# Altium schematic sheet Keyb_ESP32_simple.SchDoc
size A4; SheetNumber: 1; SheetTotal: 2
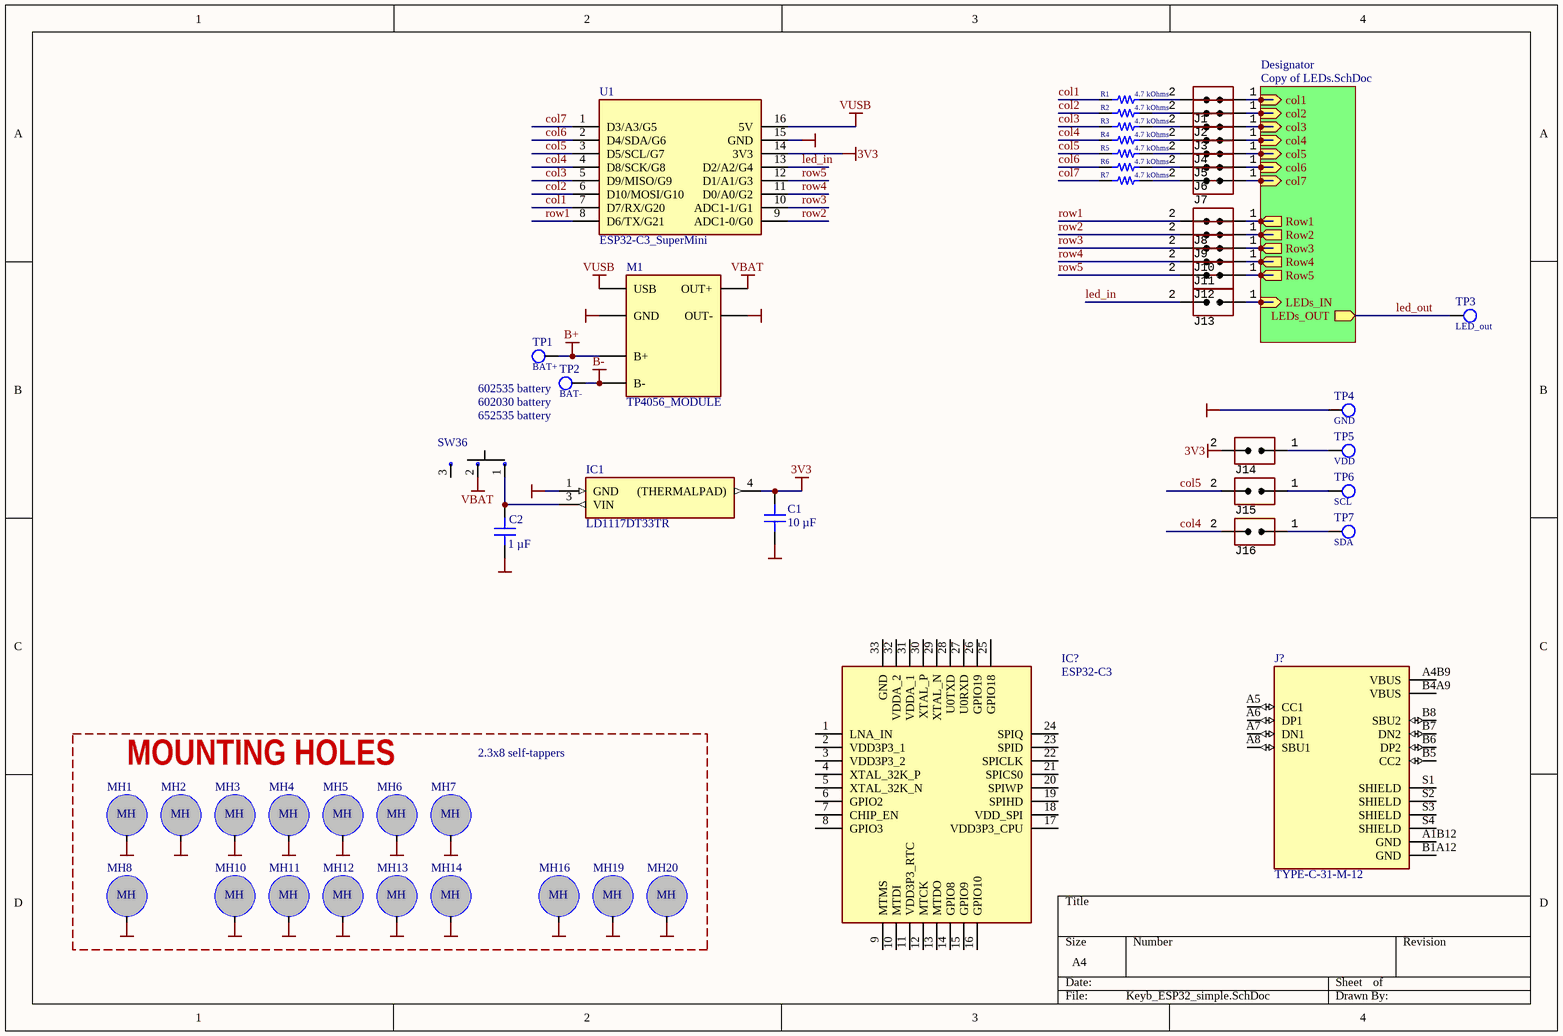
[diagram p0: Keyb_ESP32_simple.SchDoc]

## Parts
C1  10 µF  [CAP 0805_2012]
C2  1 µF  [CAP 0805_2012]
IC1  LD1117DT33TR  [TO228P972X240-3N]
IC?  ESP32-C3  [QFN50P500X500X90-33N-D]
J1  (no value)  [CON: JUMPER x1]
J2  (no value)  [CON: JUMPER x1]
J3  (no value)  [CON: JUMPER x1]
J4  (no value)  [CON: JUMPER x1]
J5  (no value)  [CON: JUMPER x1]
J6  (no value)  [CON: JUMPER x1]
J7  (no value)  [CON: JUMPER x1]
J8  (no value)  [CON: JUMPER x1]
J9  (no value)  [CON: JUMPER x1]
J10  (no value)  [CON: JUMPER x1]
J11  (no value)  [CON: JUMPER x1]
J12  (no value)  [CON: JUMPER x1]
J13  (no value)  [CON: JUMPER x1]
J14  (no value)  [CON: JUMPER x1]
J15  (no value)  [CON: JUMPER x1]
J16  (no value)  [CON: JUMPER x1]
J?  TYPE-C-31-M-12  [HRO_TYPE-C-31-M-12]
M1  TP4056_MODULE  [TP4056_MODULE]
MH1  MountingHole  [Hole_2.5mm]  (value not drawn)
MH2  MountingHole  [Hole_2.5mm]  (value not drawn)
MH3  MountingHole  [Hole_2.5mm]  (value not drawn)
MH4  MountingHole  [Hole_2.5mm]  (value not drawn)
MH5  MountingHole  [Hole_2.5mm]  (value not drawn)
MH6  MountingHole  [Hole_2.5mm]  (value not drawn)
MH7  MountingHole  [Hole_2.5mm]  (value not drawn)
MH8  MountingHole  [Hole_2.5mm]  (value not drawn)
MH10  MountingHole  [Hole_2.5mm]  (value not drawn)
MH11  MountingHole  [Hole_2.5mm]  (value not drawn)
MH12  MountingHole  [Hole_2.5mm]  (value not drawn)
MH13  MountingHole  [Hole_2.5mm]  (value not drawn)
MH14  MountingHole  [Hole_2.5mm]  (value not drawn)
MH16  MountingHole  [Hole_2.5mm]  (value not drawn)
MH19  MountingHole  [Hole_2.5mm]  (value not drawn)
MH20  MountingHole  [Hole_2.5mm]  (value not drawn)
R1  4.7 kOhms  [RES 0603_1608]
R2  4.7 kOhms  [RES 0603_1608]
R3  4.7 kOhms  [RES 0603_1608]
R4  4.7 kOhms  [RES 0603_1608]
R5  4.7 kOhms  [RES 0603_1608]
R6  4.7 kOhms  [RES 0603_1608]
R7  4.7 kOhms  [RES 0603_1608]
SW36  RockerSwitch_3mm  [SLIDE_SW_BIG]  (value not drawn)
TP1  BAT+  [TESTPOINT_PAD]
TP2  BAT-  [TESTPOINT_PAD]
TP3  LED_out  [TESTPOINT_PAD]
TP4  GND  [TESTPOINT_PAD]
TP5  VDD  [TESTPOINT_PAD]
TP6  SCL  [TESTPOINT_PAD]
TP7  SDA  [TESTPOINT_PAD]
U1  ESP32-C3_SuperMini  [ESP32-C3_SUPER_MINI]

## Blocks framed on the sheet
MOUNTING HOLES: MH1-MH8 MH10-MH14 MH16 MH19 MH20

## Sub-sheets
Designator = Copy of LEDs.SchDoc: col1 (in), col4 (in), col2 (in), col7 (in), col5 (in), col3 (in), col6 (in), Row5 (out), Row1 (out), Row2 (out), Row3 (out), Row4 (out), LEDs_IN (in), LEDs_OUT (out)

## Nets
3V3: C1.2 IC1.4((THERMALPAD)) J14.2(IN) U1.14(3V3)
B+: M1.B+ TP1.1
B-: M1.B- TP2.1
GND: C1.1 C2.1 IC1.1(GND) M1.GND M1.OUT- MH1.0 MH2.0 MH3.0 MH4.0 MH5.0 MH6.0 MH7.0 MH8.0 MH10.0 MH11.0 MH12.0 MH13.0 MH14.0 MH16.0 MH19.0 MH20.0 TP4.1 U1.15(GND)
VBAT: M1.OUT+ SW36.2
VUSB: M1.USB U1.16(5V)
col1: R1.2 U1.7(D7/RX/G20)
col2: R2.2 U1.6(D10/MOSI/G10)
col3: R3.2 U1.5(D9/MISO/G9)
col4: J16.2(IN) R4.2 U1.4(D8/SCK/G8)
col5: J15.2(IN) R5.2 U1.3(D5/SCL/G7)
col6: R6.2 U1.2(D4/SDA/G6)
col7: R7.2 U1.1(D3/A3/G5)
led_in: J13.2(IN) U1.13(D2/A2/G4)
led_out: TP3.1 ; sheet Designator/LEDs_OUT
row1: J8.2(IN) U1.8(D6/TX/G21)
row2: J9.2(IN) U1.9(ADC1-0/G0)
row3: J10.2(IN) U1.10(ADC1-1/G1)
row4: J11.2(IN) U1.11(D0/A0/G2)
row5: J12.2(IN) U1.12(D1/A1/G3)
NetC2_2: C2.2 IC1.3(VIN) SW36.1
NetJ1_1: J1.1(IN) ; sheet Designator/col1
NetJ1_2: J1.2(IN) R1.1
NetJ2_1: J2.1(IN) ; sheet Designator/col2
NetJ2_2: J2.2(IN) R2.1
NetJ3_1: J3.1(IN) ; sheet Designator/col3
NetJ3_2: J3.2(IN) R3.1
NetJ4_1: J4.1(IN) ; sheet Designator/col4
NetJ4_2: J4.2(IN) R4.1
NetJ5_1: J5.1(IN) ; sheet Designator/col5
NetJ5_2: J5.2(IN) R5.1
NetJ6_1: J6.1(IN) ; sheet Designator/col6
NetJ6_2: J6.2(IN) R6.1
NetJ7_1: J7.1(IN) ; sheet Designator/col7
NetJ7_2: J7.2(IN) R7.1
NetJ8_1: J8.1(IN) ; sheet Designator/Row1
NetJ9_1: J9.1(IN) ; sheet Designator/Row2
NetJ10_1: J10.1(IN) ; sheet Designator/Row3
NetJ11_1: J11.1(IN) ; sheet Designator/Row4
NetJ12_1: J12.1(IN) ; sheet Designator/Row5
NetJ13_1: J13.1(IN) ; sheet Designator/LEDs_IN
NetJ14_1: J14.1(IN) TP5.1
NetJ15_1: J15.1(IN) TP6.1
NetJ16_1: J16.1(IN) TP7.1

Not connected (* = marked no-connect by the designer): IC? 1(LNA_IN) 2(VDD3P3_1) 3(VDD3P3_2) 4(XTAL_32K_P) 5(XTAL_32K_N) 6(GPIO2) 7(CHIP_EN) 8(GPIO3) 9(MTMS) 10(MTDI) 11(VDD3P3_RTC) 12(MTCK) 13(MTDO) 14(GPIO8) 15(GPIO9) 16(GPIO10) 17(VDD3P3_CPU) 18(VDD_SPI) 19(SPIHD) 20(SPIWP) 21(SPICS0) 22(SPICLK) 23(SPID) 24(SPIQ) 25(GPIO18) 26(GPIO19) 27(U0RXD) 28(U0TXD) 29(XTAL_N) 30(XTAL_P) 31(VDDA_1) 32(VDDA_2) 33(GND); J? A1B12(GND) A4B9(VBUS) A5(CC1) A6(DP1) A7(DN1) A8(SBU1) B1A12(GND) B4A9(VBUS) B5(CC2) B6(DP2) B7(DN2) B8(SBU2) S1(SHIELD) S2(SHIELD) S3(SHIELD) S4(SHIELD); SW36 3

## Notes on the sheet
- (near TP2) 602535 battery
- (near TP2) 602030 battery
- 652535 battery
- 2.3x8 self-tappers
- (in symbol MountingHole) MH

## Library data of the parts
C1 = C0805C106K8PAC7800: CAP CER 10UF 10V X5R 0805; manufacturer: KEMET; Tolerance: ±10%; Part Number: C0805C106K8PAC7800; Value: 10 µF; Applications: Bypass, Decoupling; Capacitance: 10 µF; componentlink1description: Datasheet; componentlink1url: https://connect.kemet.com:7667/gateway/IntelliData-ComponentDocumentation/1.0/download/datasheet/C0805C106K8PACTU; componentlink2description: DigiKey Link; componentlink2url: https://www.digikey.com/en/products/detail/kemet/C0805C106K8PAC7800/1090830; Device Package: 0805 (2012 Metric); lastupdated: 9/14/2022 7:51:56 AM; Lifecycle Status: Active; Minimum Order: 1; Mounting Type: Surface Mount, MLCC; Operating Temperature: -55°C ~ 85°C; Package / Case: 0805 (2012 Metric); packaging: TapeAndReel; partid: 44790; Part Status: Active; price: 0.02; series: SMD Comm X5R; Size / Dimension: 0.079" L x 0.049" W (2.00mm x 1.25mm); Supplier 1: DigiKey; Supplier Part Number 1: 399-C0805C106K8PAC7800CT-ND; Temperature Coefficient: X5R; Thickness (Max): 0.055" (1.40mm); Voltage - Rated: 10V
C2 = C0805C105K4RAC7800: CAP CER 1UF 16V X7R 0805; manufacturer: KEMET; Tolerance: ±10%; Part Number: C0805C105K4RAC7800; Value: 1 µF; Applications: Bypass, Decoupling; Capacitance: 1 µF; componentlink1description: Datasheet; componentlink1url: https://api.kemet.com/component-edge/download/datasheet/C0805C105K4RACTU.pdf; componentlink2description: DigiKey Link; componentlink2url: https://www.digikey.com/en/products/detail/kemet/C0805C105K4RAC7800/416047; Device Package: 0805 (2012 Metric); lastupdated: 9/19/2022 1:03:30 PM; Lifecycle Status: Active; Minimum Order: 1; Mounting Type: Surface Mount, MLCC; Operating Temperature: -55°C ~ 125°C; Package / Case: 0805 (2012 Metric); packaging: TapeAndReel; partid: 32075; Part Status: Active; price: 0.01; series: SMD Comm X7R; Size / Dimension: 0.079" L x 0.049" W (2.00mm x 1.25mm); Supplier 1: DigiKey; Supplier Part Number 1: 399-C0805C105K4RAC7800CT-ND; Temperature Coefficient: X7R; Thickness (Max): 0.039" (1.00mm); Voltage - Rated: 16V
IC1 = LD1117DT33TR: Integrated Circuit; Manufacturer_Name: STMicroelectronics; Datasheet Link: http://www.st.com/web/en/resource/technical/document/datasheet/CD00000544.pdf; Height: 2.4mm; Manufacturer_Part_Number: LD1117DT33TR; Mouser Part Number: 511-LD1117DT33-TR; Mouser Price/Stock: https://www.mouser.co.uk/ProductDetail/STMicroelectronics/LD1117DT33TR?qs=4JhUBQGAOSd4P5jVYGxp2g%3D%3D; Arrow Part Number: LD1117DT33TR; Arrow Price/Stock: https://www.arrow.com/en/products/ld1117dt33tr/stmicroelectronics?region=nac
IC? = ESP32-C3: Integrated Circuit; Manufacturer_Name: Espressif Systems; Datasheet Link: https://www.espressif.com/sites/default/files/documentation/esp32-c3_datasheet_en.pdf; Height: 0.9mm; Manufacturer_Part_Number: ESP32-C3; Mouser Part Number: 356-ESP32-C3; Mouser Price/Stock: https://www.mouser.co.uk/ProductDetail/Espressif-Systems/ESP32-C3?qs=iLbezkQI%252BsiMXe7tMG%252Bo%2FA%3D%3D
J1-J16 = Jumper_single: CommentText: "Перемычка"
J? = TYPE-C-31-M-12: USB Connectors 24 Receptacle 1 8.94*7.3mm RoHS; MF: {'manufacturer': u'HRO Electronics Co., Ltd.'}; Package: None; Price: None; Value: *; MP: TYPE-C-31-M-12; Availability: Unavailable
R1-R7 = ERJ-U03J472V: RES 4.7K OHM 5% 1/10W 0603 SMD; Manufacturer: Panasonic Electronic Components; Power (Watts): 0.1W, 1/10W; Temperature Coefficient: ±200ppm/°C; Part Number: ERJ-U03J472V; Value: 4.7 kOhms; ComponentLink1Description: Datasheet; ComponentLink1URL: https://industrial.panasonic.com/cdbs/www-data/pdf/RDP0000/AOA0000C334.pdf; ComponentLink2Description: DigiKey Link; ComponentLink2URL: https://www.digikey.com/en/products/detail/panasonic-electronic-components/ERJ-U03J472V/11631906; Composition: Thick Film; Device Package: 0603 (1608 Metric); Features: Anti-Sulfur, Automotive AEC-Q200; Height - Seated (Max): 0.022" (0.55mm); LastUpdated: 2/9/2024 8:41:20 PM; Lifecycle Status: Active; Minimum Order: 1; Number of Terminations: 2; Operating Temperature: -55°C ~ 155°C; Package / Case: 0603 (1608 Metric); Packaging: TapeAndReel; PartId: 62126; Part Status: Active; Price: 0.01; Ratings: AEC-Q200; Resistance: 4.7 kOhms; Series: ERJ-U03; Size / Dimension: 0.063" L x 0.031" W (1.60mm x 0.80mm); Supplier 1: DigiKey; Supplier Part Number 1: 10-ERJ-U03J472VCT-ND; Supplier Device Package: 0603; Tolerance: ±5%
SW36 = RockerSwitch_3mm: Slide switch L-KLS7-SS-12F19-G5
TP1-TP7 = TestPoint